# Altium project JETSON_Adapter.PrjPcb
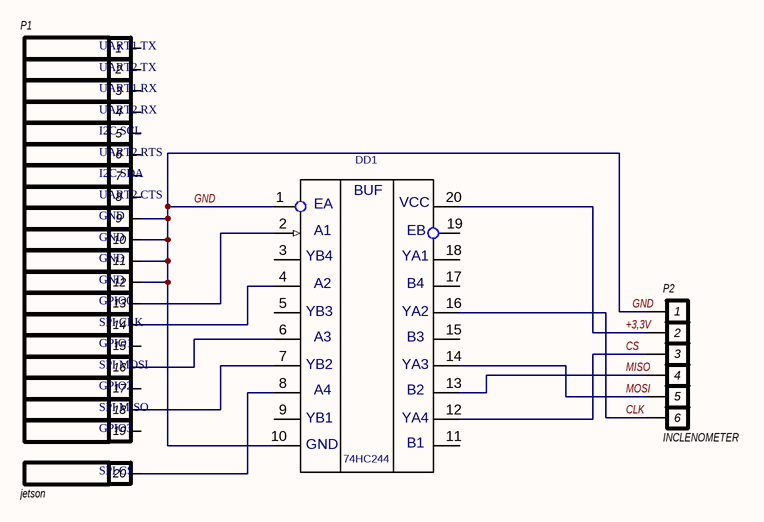
[diagram p0: Adapter.SchDoc]
1 sheet, 3 parts. Net scope: global (net labels, ports and power ports of the same name join across sheets).
Board file: Adapter.PcbDoc

## Sheet Adapter.SchDoc
size A4; Organization: HOME; Address1: L3, 12a Rodborough Rd; Address2: Frenchs Forest; Address3: NSW; Address4: Australia 2086; PageSetup: Record=PageOptions|CenterHorizontal=True|CenterVertical=True|PrintScale=0.49|XCorrection=1.00|YCorrection=1.00|PrintKind=0|BorderSize=5000000|LeftOffset=0|BottomOffset=0|Orientation=2|PaperLength=1000|PaperWidth=1000|Scale=100|PaperSource=7|PrintQuality=-3|MediaType=1|DitherType=10|PrintScaleMode=1|PaperKind=A4|PaperIndex=9

### Parts
DD1  74HC244  [DIP20]
P1  jetson  [HDMI TYPE A]
P2  INCLENOMETER  [Header 6]

### Nets
+3,3V: DD1.20 P2.2
CLK: DD1.16 P2.6
CS: DD1.12 P2.3
GND: DD1.1 DD1.10 P1.9 P1.10 P1.11 P1.12 P2.1
MISO: DD1.13 P2.4
MOSI: DD1.14 P2.5
NetDD1_2: DD1.2 P1.13
NetDD1_4: DD1.4 P1.14
NetDD1_6: DD1.6 P1.16
NetDD1_7: DD1.7 P1.18
NetDD1_8: DD1.8 P1.20

Not connected (* = marked no-connect by the designer): DD1 3 5 9 11 15 17 18 19; P1 1 2 3 4 5 6 7 8 15 17 19

### Notes on the sheet
- Title
- Size:
- Date:
- File:
- A2
- Number:
- Time:
- Revision:
- Sheet
- of

### Library data of the parts
P1 = Port 20: pin to pad: 20>S1; P1: UART1 TX; P2: UART2 TX; P3: UART1 RX; P4: UART2 RX; P5: I2C SCL; P6: UART2 RTS; P7: I2C SDA; P8: UART2 CTS; P9: GND; P13: GPIO0; P14: SPI CLK; P15: GPIO1; P16: SPI MOSI; P17: GPIO2; P18: SPI MISO; P19: GPIO3; P20: SPI CS; P10: GND; P11: GND; P12: GND
P2 = Header 6
DD1 = 74HC244: Value: *